# Altium project GP315.PrjPcb
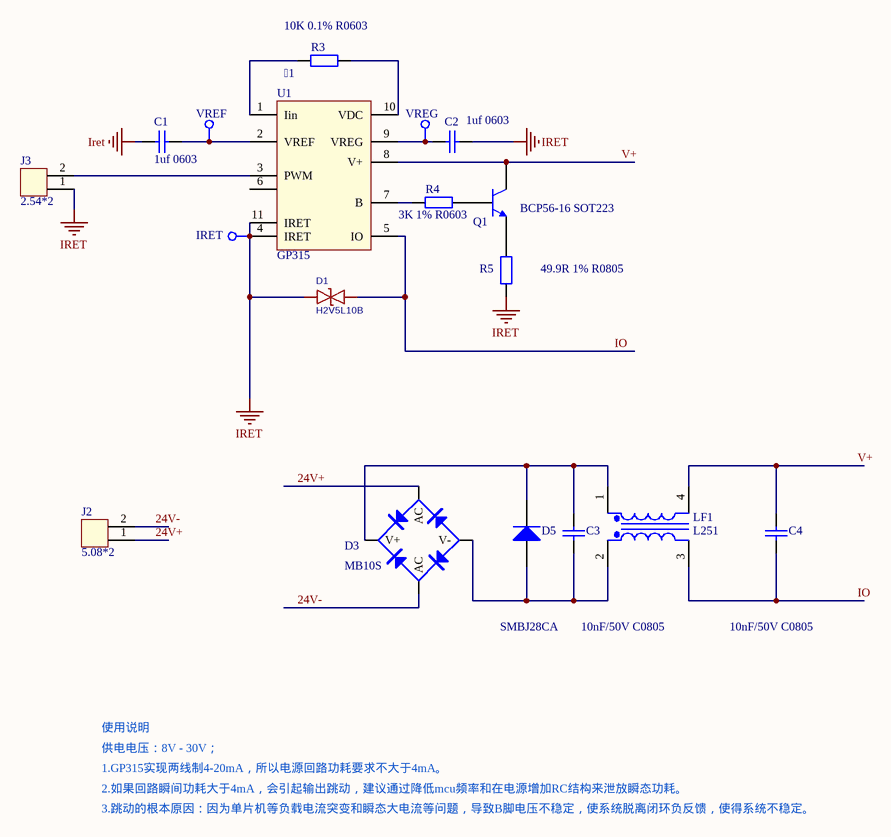
[diagram p0: GP315.SchDoc]
1 sheet, 18 parts. Net scope: global (net labels, ports and power ports of the same name join across sheets).
Board file: GP315.PcbDoc

## Sheet GP315.SchDoc
size A4

### Parts
C1  1uf 0603  [CAP_0603]
C2  1uf 0603  [CAP_0603]
C3  10nF/50V C0805  [CAP_0805]
C4  10nF/50V C0805  [CAP_0805]
D1  H2V5L10B  [DFN1006-2L_L1.0-W0.6-P0.64-BI]
D3  MB10S  [MB10S]
D5  SMBJ28CA  [DIODE_SMB]
IRET  TEST  [Hole_Test]  (value not drawn)
J2  5.08*2  [5.08_2P_W]
J3  2.54*2  [2.54-1*2]
LF1  L251  [共模电感]
Q1  BCP56-16 SOT223  [NPN_SOT223]
R3  10K 0.1% R0603  value 1  [RES_0603]
R4  3K 1% R0603  [RES_0603]
R5  value 49.9R 1% R0805  [RES_0805]  (hidden comment: 24.9R 1% R0805)
U1  GP315  [MSOP10]
VREF  TEST  [Hole_Test]  (value not drawn)
VREG  TEST  [Hole_Test]  (value not drawn)

### Nets
Iret: C1.1 C2.2 D1.1 IRET.1(SHell) J3.1 R5.2 U1.4(IRET) U1.11(IRET)
24V+: D3.2(AC) J2.1
24V-: D3.1(AC) J2.2
IO: C4.1 D1.2 LF1.3(Sec-) U1.5(IO)
V+: C4.2 LF1.4(Pri-) Q1.2 Q1.4 U1.8(V+)
NetC1_2: C1.2 U1.2(VREF) VREF.1(SHell)
NetC2_1: C2.1 U1.9(VREG) VREG.1(SHell)
NetC3_1: C3.1 D3.4(V-) D5.1(A) LF1.2(Sec+)
NetC3_2: C3.2 D3.3(V+) D5.2(K) LF1.1(Pri+)
NetJ3_2: J3.2 U1.3(PWM)
NetQ1_1: Q1.1 R4.1
NetQ1_3: Q1.3 R5.1
NetR3_1: R3.1 U1.10(VDC)
NetR3_2: R3.2 U1.1(Iin)
NetR4_2: R4.2 U1.7(B)

Not connected (* = marked no-connect by the designer): U1 6

### Notes on the sheet
- 使用说明
- 1.GP315实现两线制4-20mA，所以电源回路功耗要求不大于4mA。
- 2.如果回路瞬间功耗大于4mA，会引起输出跳动，建议通过降低mcu频率和在电源增加RC结构来泄放瞬态功耗。
- 供电电压：8V - 30V；
- 3.跳动的根本原因：因为单片机等负载电流突变和瞬态大电流等问题，导致B脚电压不稳定，使系统脱离闭环负反馈，使得系统不稳定。

### Library data of the parts
C1 C2 = C 0603: Published: 8-Jun-2000; LatestRevisionDate: 17-Jul-2002; LatestRevisionNote: Re-released for DXP Platform.; PackageReference: RAD-0.3; Publisher: Altium Limited; PackageDescription: Radial Cap, Thru-Hole; 2 Leads; 0.3 in Pin Spacing
C3 C4 = C0805: Published: 8-Jun-2000; LatestRevisionDate: 17-Jul-2002; LatestRevisionNote: Re-released for DXP Platform.; PackageReference: RAD-0.3; Publisher: Altium Limited; PackageDescription: Radial Cap, Thru-Hole; 2 Leads; 0.3 in Pin Spacing; Value: 10nF/50V C0805
D1 = H2V5L10B: 极性:双向;反向截止电压(Vrwm):2.5V;钳位电压:10V;峰值脉冲电流(Ipp):10A;峰值脉冲功率(Ppp):100W;击穿电压(VBR):2.8V;; Manufacturer: R+O(宏嘉诚); AddInBom: yes; Polarity: 双向; Reverse Stand-Off Voltage (Vrwm): 2.5V; Clamping Voltage: 10V; Peak Pulse Current (Ipp): 10A; Peak Pulse Power Dissipation (Ppp): 100W; Voltage - Breakdown: 2.8V; Reverse Leakage Current (Ir): 500nA; Type: ESD; Junction Capacitance: 5pF; Symbol: H2V5L10B; Device: H2V5L10B; LCSC Part Name: 双向 2.5V 10A; SupplierPart: C51139755; ManufacturerPart: H2V5L10B; Supplier Footprint: DFN1006-2L; JLCPCB Part Class: Extended Part; Datasheet: https://item.szlcsc.com/datasheet/H2V5L10B/53789265.html; Supplier: LCSC; ConvertToPcb: yes; FootprintName: DFN1006-2L_L1.0-W0.6-P0.64-BI; Operating Temperature: -55℃~+125℃
D5 = SMBJxxA: Published: 8-Jun-2000; LatestRevisionDate: 17-Jul-2002; LatestRevisionNote: Re-released for DXP Platform.; DatasheetVersion: 1997; PackageReference: DO-35; Publisher: Altium Limited; PackageDescription: Diode, Axial; Body 3.8 x 1.9 mm (LxDia. max), Lead Dia. 0.53 mm (max); Code_JEDEC: DO-204-AH; ComponentLink1Description: Manufacturer Link; ComponentLink1URL: http://www.fairchildsemi.com/; ComponentLink2Description: Datasheet; ComponentLink2URL: http://www.fairchildsemi.com/ds/1N%2F1N4148.pdf
IRET VREF VREG = Hole
J2 J3 = 5.08*2_W
LF1 = 共模电感: Transformer (Ideal)_共模电感; Published: 8-Jun-2000; LatestRevisionDate: 17-Jul-2002; LatestRevisionNote: Re-released for DXP Platform.; PackageReference: TRF_4; Publisher: Altium Limited; PackageDescription: Transformer; 4 Leads
Q1 = NPN_SOT223
R3 = Res2: 20K 0.1% R0603; Published: 8-Jun-2000; LatestRevisionDate: 17-Jul-2002; LatestRevisionNote: Re-released for DXP Platform.; PackageReference: AXIAL-0.4; Publisher: Altium Limited; PackageDescription: Axial Device, Thru-Hole; 2 Leads; 0.4 in Pin Spacing
R4 R5 = Res2: Published: 8-Jun-2000; LatestRevisionDate: 17-Jul-2002; LatestRevisionNote: Re-released for DXP Platform.; PackageReference: AXIAL-0.4; Publisher: Altium Limited; PackageDescription: Axial Device, Thru-Hole; 2 Leads; 0.4 in Pin Spacing
  R4: Value: 3K 1% R0603